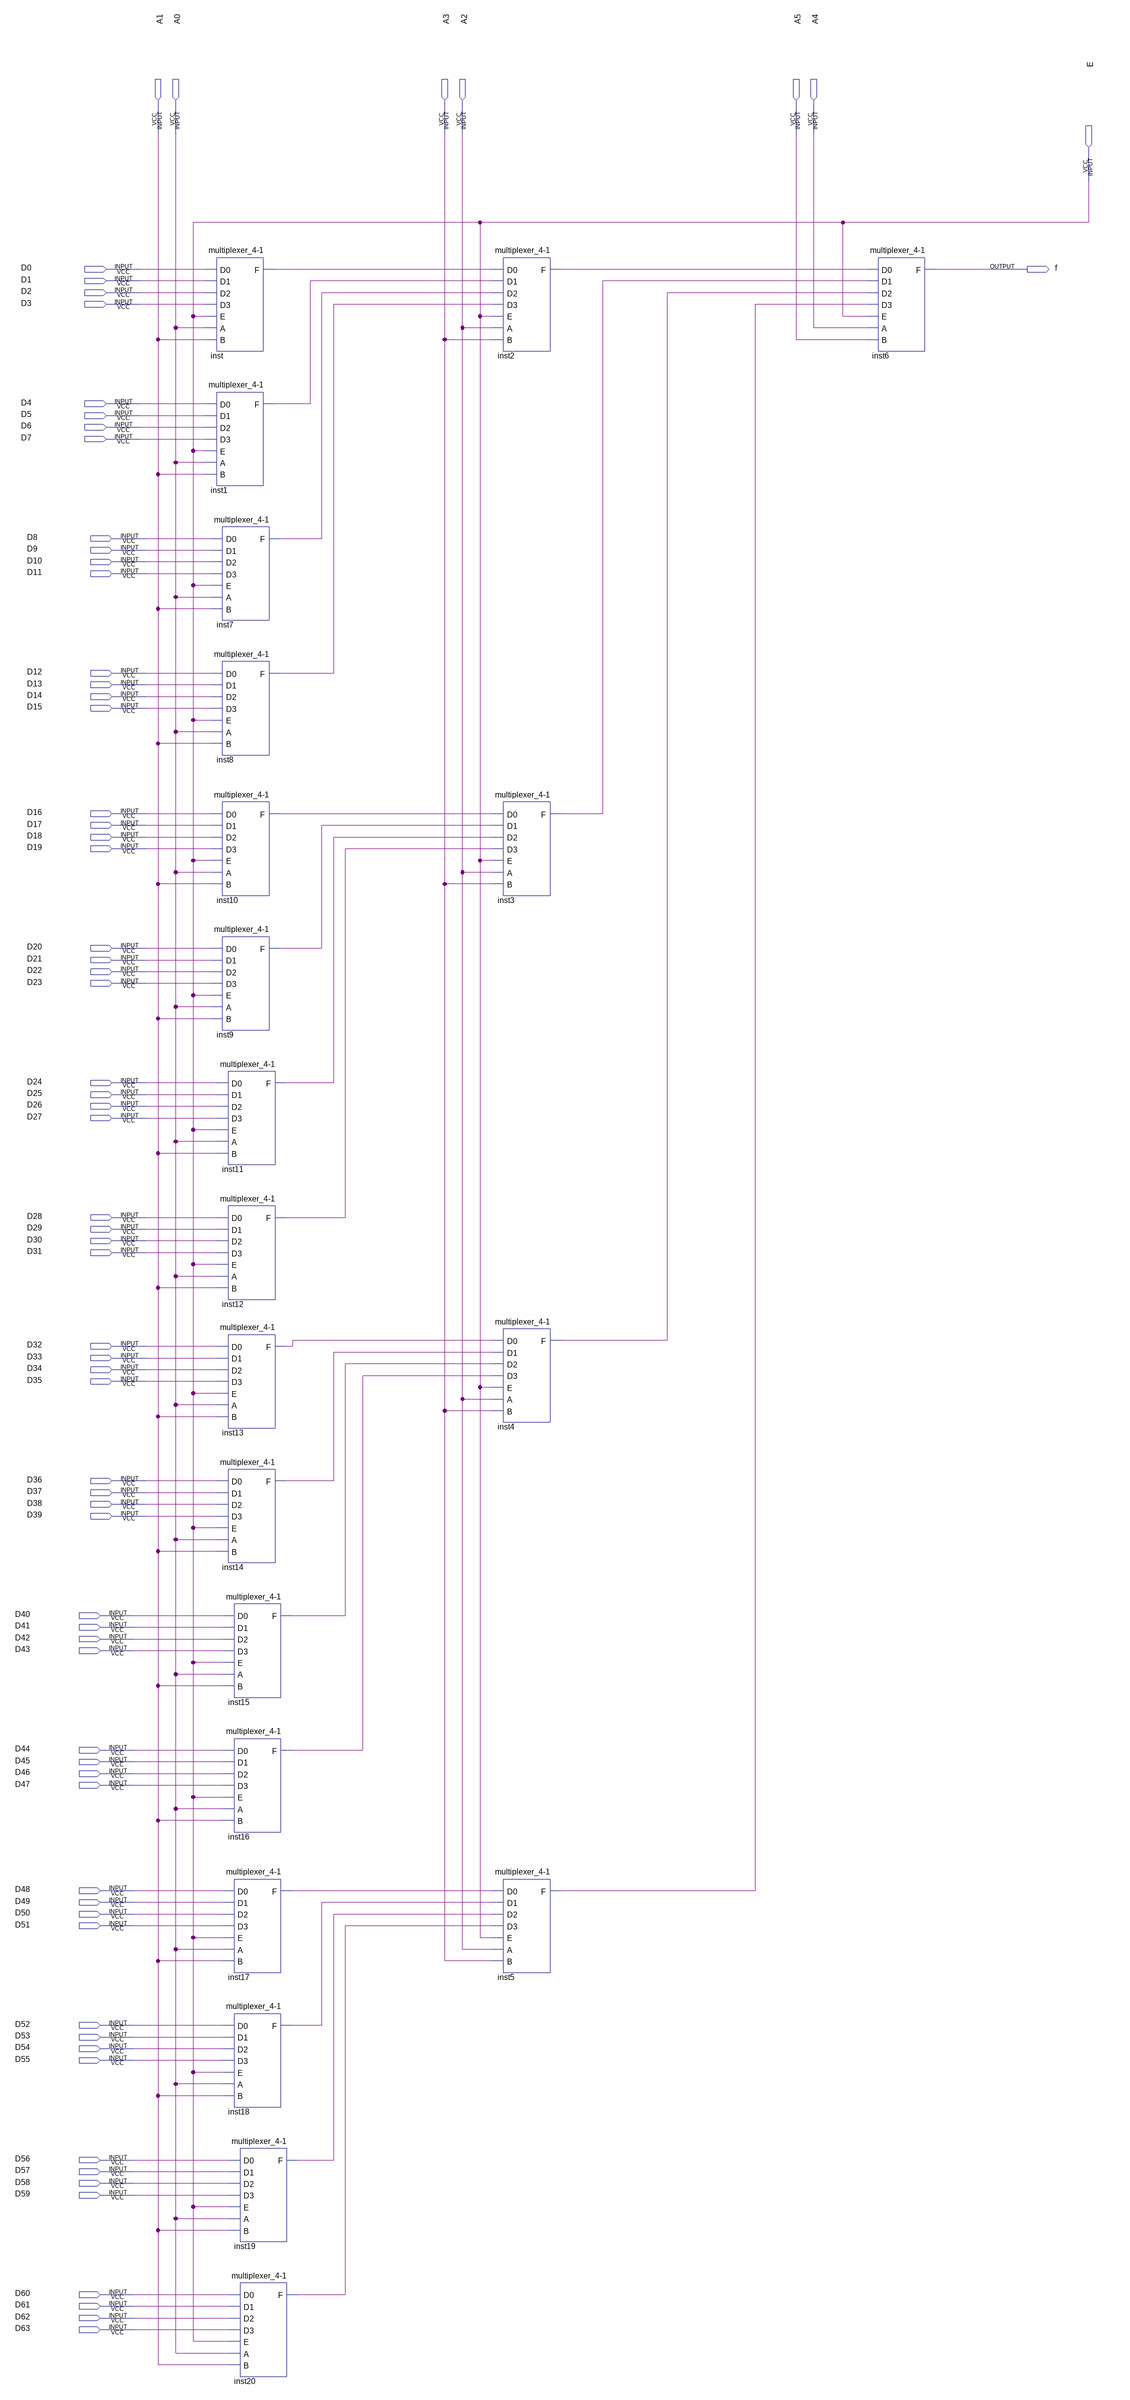
[diagram p0: schematic sheet]
// Quartus schematic multiplexer_64-1.bdf as structural Verilog: 21 symbols, 72 pins
module \multiplexer_64-1  (
  input  A1,
  input  A0,
  input  A3,
  input  A2,
  input  A5,
  input  A4,
  input  E,
  input  D0,
  input  D1,
  input  D2,
  input  D3,
  input  D4,
  input  D5,
  input  D6,
  input  D7,
  input  D8,
  input  D9,
  input  D10,
  input  D11,
  input  D12,
  input  D13,
  input  D14,
  input  D15,
  input  D16,
  input  D17,
  input  D18,
  input  D19,
  input  D20,
  input  D21,
  input  D22,
  input  D23,
  input  D24,
  input  D25,
  input  D26,
  input  D27,
  input  D28,
  input  D29,
  input  D30,
  input  D31,
  input  D32,
  input  D33,
  input  D34,
  input  D35,
  input  D36,
  input  D37,
  input  D38,
  input  D39,
  input  D40,
  input  D41,
  input  D42,
  input  D43,
  input  D44,
  input  D45,
  input  D46,
  input  D47,
  input  D48,
  input  D49,
  input  D50,
  input  D51,
  input  D52,
  input  D53,
  input  D54,
  input  D55,
  input  D56,
  input  D57,
  input  D58,
  input  D59,
  input  D60,
  input  D61,
  input  D62,
  input  D63,
  output f
);

  wire inst1_f, inst2_f, inst3_f, inst4_f, inst5_f, inst7_f, inst8_f, inst9_f, inst10_f, inst11_f, inst12_f,
       inst13_f, inst14_f, inst15_f, inst16_f, inst17_f, inst18_f, inst19_f, inst20_f, inst_f;

  \multiplexer_4-1  inst (.D0(D0), .D1(D1), .D2(D2), .D3(D3), .E(E), .A(A0), .B(A1), .F(inst_f));
  \multiplexer_4-1  inst1 (.D0(D4), .D1(D5), .D2(D6), .D3(D7), .E(E), .A(A0), .B(A1), .F(inst1_f));
  \multiplexer_4-1  inst7 (.D0(D8), .D1(D9), .D2(D10), .D3(D11), .E(E), .A(A0), .B(A1), .F(inst7_f));
  \multiplexer_4-1  inst8 (.D0(D12), .D1(D13), .D2(D14), .D3(D15), .E(E), .A(A0), .B(A1), .F(inst8_f));
  \multiplexer_4-1  inst10 (.D0(D16), .D1(D17), .D2(D18), .D3(D19), .E(E), .A(A0), .B(A1), .F(inst10_f));
  \multiplexer_4-1  inst9 (.D0(D20), .D1(D21), .D2(D22), .D3(D23), .E(E), .A(A0), .B(A1), .F(inst9_f));
  \multiplexer_4-1  inst11 (.D0(D24), .D1(D25), .D2(D26), .D3(D27), .E(E), .A(A0), .B(A1), .F(inst11_f));
  \multiplexer_4-1  inst12 (.D0(D28), .D1(D29), .D2(D30), .D3(D31), .E(E), .A(A0), .B(A1), .F(inst12_f));
  \multiplexer_4-1  inst13 (.D0(D32), .D1(D33), .D2(D34), .D3(D35), .E(E), .A(A0), .B(A1), .F(inst13_f));
  \multiplexer_4-1  inst14 (.D0(D36), .D1(D37), .D2(D38), .D3(D39), .E(E), .A(A0), .B(A1), .F(inst14_f));
  \multiplexer_4-1  inst15 (.D0(D40), .D1(D41), .D2(D42), .D3(D43), .E(E), .A(A0), .B(A1), .F(inst15_f));
  \multiplexer_4-1  inst16 (.D0(D44), .D1(D45), .D2(D46), .D3(D47), .E(E), .A(A0), .B(A1), .F(inst16_f));
  \multiplexer_4-1  inst17 (.D0(D48), .D1(D49), .D2(D50), .D3(D51), .E(E), .A(A0), .B(A1), .F(inst17_f));
  \multiplexer_4-1  inst18 (.D0(D52), .D1(D53), .D2(D54), .D3(D55), .E(E), .A(A0), .B(A1), .F(inst18_f));
  \multiplexer_4-1  inst19 (.D0(D56), .D1(D57), .D2(D58), .D3(D59), .E(E), .A(A0), .B(A1), .F(inst19_f));
  \multiplexer_4-1  inst20 (.D0(D60), .D1(D61), .D2(D62), .D3(D63), .E(E), .A(A0), .B(A1), .F(inst20_f));
  \multiplexer_4-1  inst2 (.D0(inst_f), .D1(inst1_f), .D2(inst7_f), .D3(inst8_f), .E(E), .A(A2), .B(A3), .F(inst2_f));
  \multiplexer_4-1  inst3 (
    .D0(inst10_f), .D1(inst9_f), .D2(inst11_f), .D3(inst12_f), .E(E), .A(A2), .B(A3), .F(inst3_f));
  \multiplexer_4-1  inst4 (
    .D0(inst13_f), .D1(inst14_f), .D2(inst15_f), .D3(inst16_f), .E(E), .A(A2), .B(A3), .F(inst4_f));
  \multiplexer_4-1  inst5 (
    .D0(inst17_f), .D1(inst18_f), .D2(inst19_f), .D3(inst20_f), .E(E), .A(A2), .B(A3), .F(inst5_f));
  \multiplexer_4-1  inst6 (.D0(inst2_f), .D1(inst3_f), .D2(inst4_f), .D3(inst5_f), .E(E), .A(A4), .B(A5), .F(f));
endmodule
